# EasyEDA Pro project curtain-lifter.epro, board PCB2
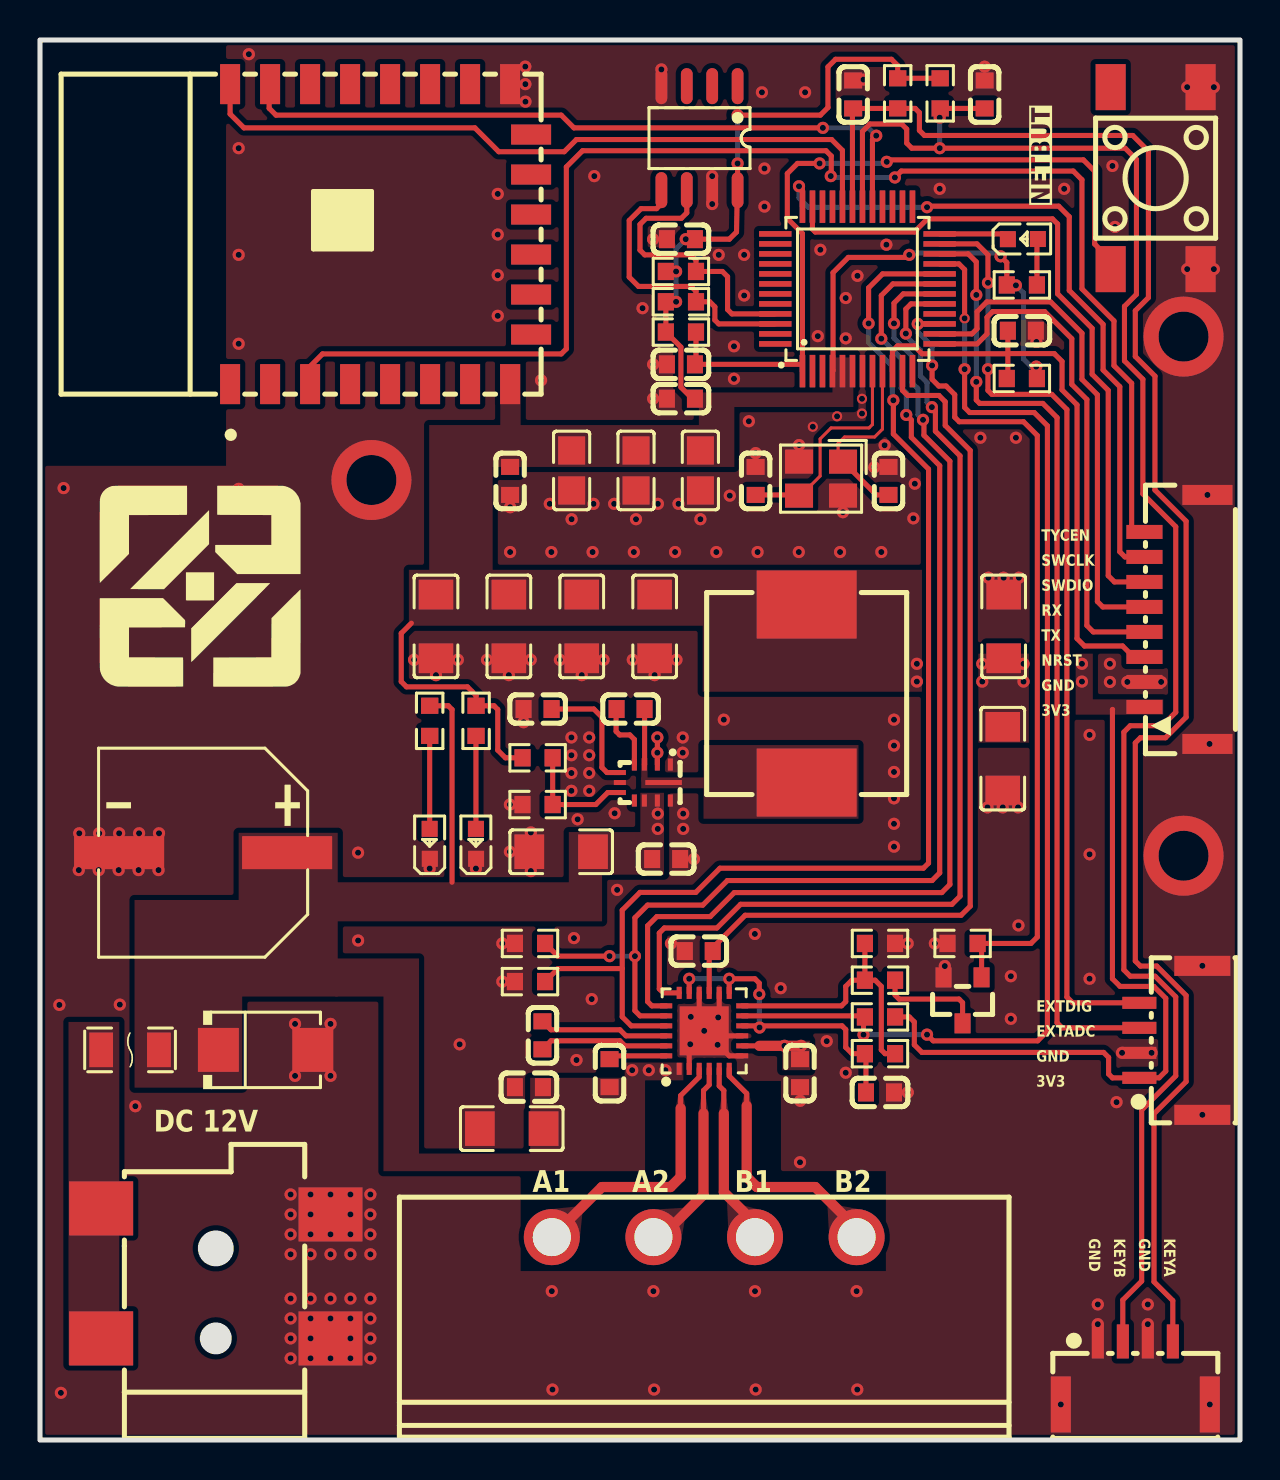
[diagram p8: board, top side]
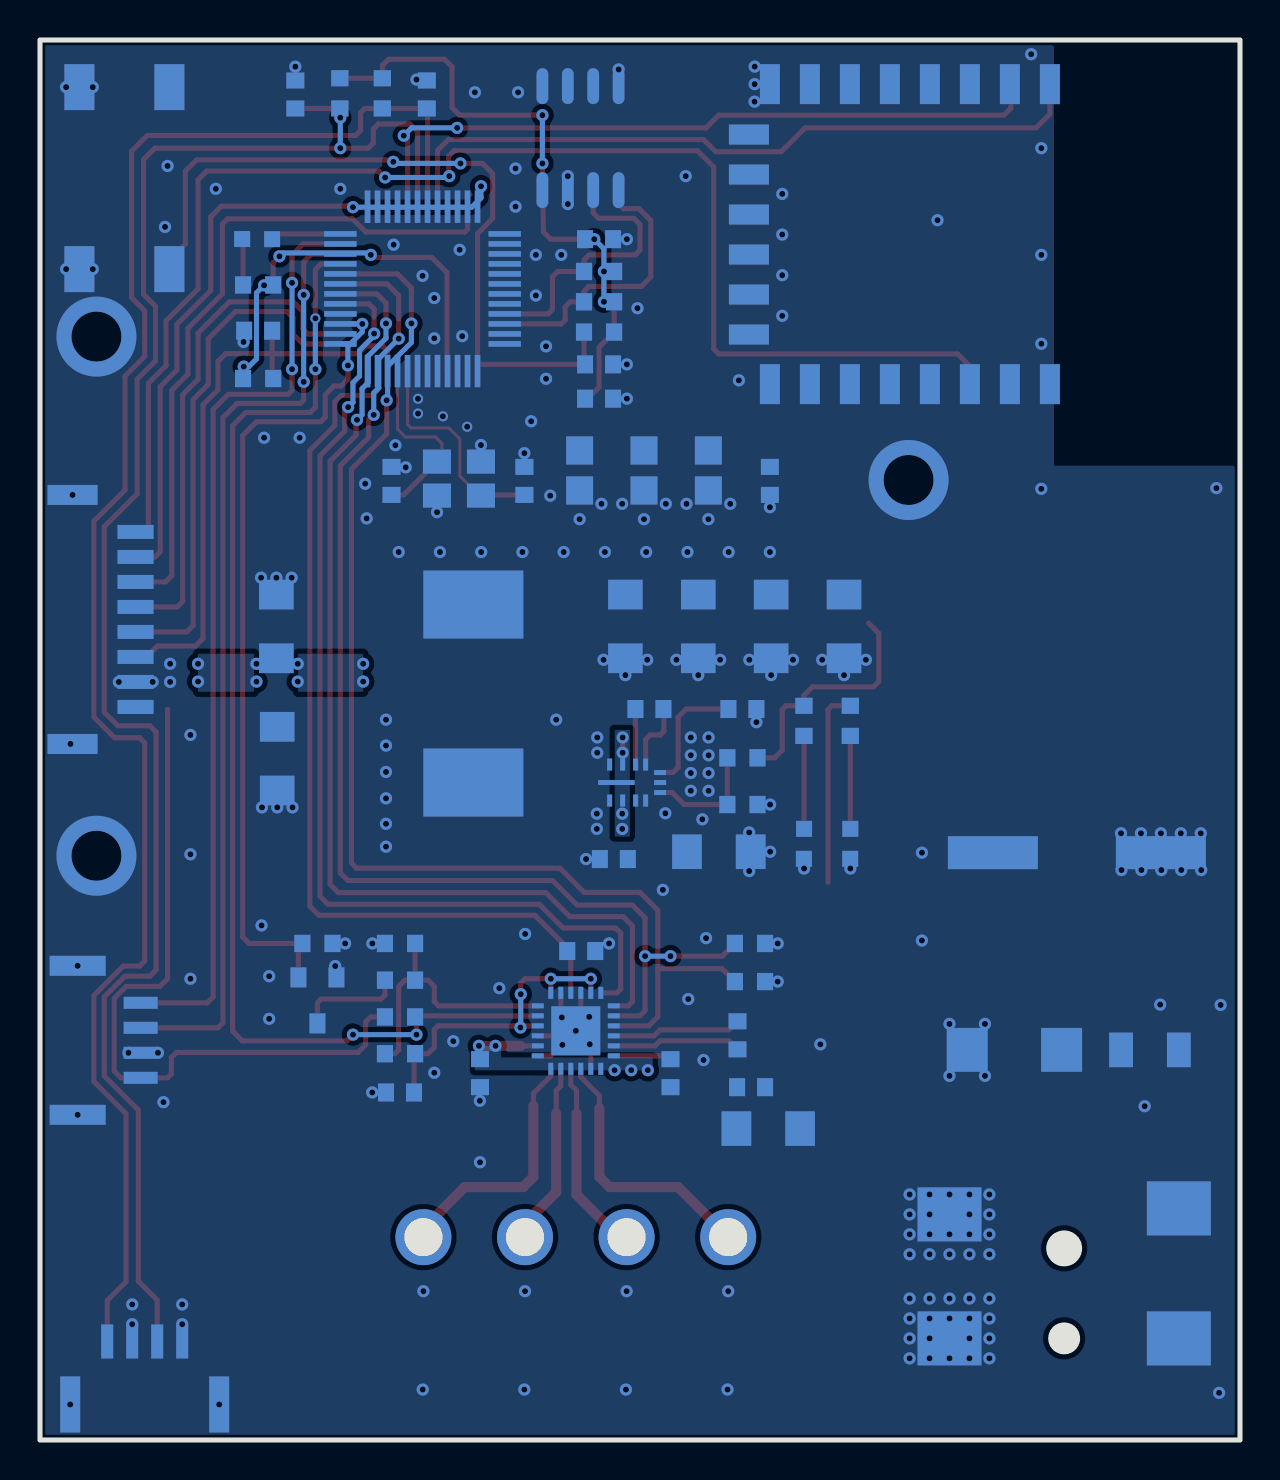
[diagram p9: board, bottom side, seen from below]

Outline 60 x 70 mm; copper layers: Top Layer, Bottom Layer. Coordinates in mm from the lower left corner of the outline.
Outline path: rectangle 0,70 60,0
Stack: Top Layer 0.035mm / Dielectric1 1.51mm FR4 er 4.5 / Bottom Layer 0.035mm

## Design rules (mm)
spacing copperThickness1oz (default): track to track 0.102, other pairs 0.152 to 0.3
spacing copperThickness2oz: track to track 0.203, other pairs 0.152 to 0.3
track width copperThickness1oz (default): min 0.127, default 0.254, max 2.54
track width copperThickness2oz: min 0.203, default 0.254, max 2.54
differential pair differentialPair (default): width min 0.127, default 0.254, max 2.54; gap min 0.152, default 0.152

## Placement (name value [footprint] x y rotation side)
C1  10uF  [C1206]  26.06 29.41 180 top
C2  100nF  [C0603]  31.31 29.05 0 top
C3  1uF  [C0603]  24.88 36.55 180 top
C4  100nF  [C0603]  29.53 36.55 0 top
C6  10uF  [C0805]  26.58 48.48 270 top
C7  12pF  [C0603]  35.78 47.95 270 top
C8  12pF  [C0603]  42.42 47.95 270 top
C9  10nF  [C0603]  24.44 17.64 180 top
C10  10nF  [C0603]  38 18.34 270 top
C11  10uF  [C1206]  23.59 15.57 0 top
C12  1uF  [C0603]  42 17.38 0 top
C13  22nF  [C0603]  25.12 20.23 270 top
C14  220nF  [C0603]  28.48 18.34 270 top
C15  1nF  [C0603]  32.94 24.45 180 top
C16  100nF  [C0603]  32.05 52.07 180 top
C17  10uF  [C0805]  29.8 48.48 270 top
C18  10uF  [C0805]  33.02 48.48 270 top
C19  100nF  [C0603]  32.05 60.04 180 top
C20  100nF  [C0603]  47.23 67.28 90 top
C21  100nF  [C0603]  23.51 47.95 270 top
C22  470uF  [CAP-SMD_BD10.0-L10.3-W10.3-LS11.0]  8.16 29.37 180 top
C23  22uF  [C1206]  48.18 40.68 90 top
C24  22uF  [C1206]  19.8 40.68 90 top
C25  22uF  [C1206]  30.73 40.68 90 top
C26  22uF  [C1206]  23.44 40.68 90 top
C27  22uF  [C1206]  27.09 40.68 90 top
C28  100nF  [C0603]  40.66 67.28 270 top
C29  100nF  [C0603]  49.09 55.46 180 top
C30  100nF  [C0603]  32.05 53.78 0 top
C31  22uF  [C1206]  48.14 34.07 270 top
CN1  SH-SM08B-GHS-TB(LF)(SN)  [CONN-SMD_SH-SM08B-GHS-TB]  56.8 41.03 90 top
CN2  DB2ERM-5.08-4P-GN  [CONN-TH_4P-P5.08_DB2ERM-5.08-4P]  33.21 10.14 0 top
D1  SMBJ15A  [SMB_L4.6-W3.6-LS5.3-RD]  11.28 19.51 0 top
DC1  DC-050-A250  [DC-IN-SMD_DC-050-A200]  8.79 8.33 90 top
F1  1206L200/16NR  [F1206]  4.5 19.51 0 top
L2  6.8uH  [IND-SMD_L11.0-W10.0_MDA1054HT]  38.33 37.32 90 top
LED1  XL-1608UBC-04  [LED0603-RD_BLUE]  19.49 29.81 90 top
LED2  XL-1608UBC-04  [LED0603-RD_BLUE]  21.8 29.81 90 top
LED3  XL-1608UBC-04  [LED0603-RD_BLUE]  49.14 60.05 0 top
Q2  CJ3400  [SOT-23_L2.9-W1.3-P1.90-LS2.4-BR]  46.13 21.98 90 top
R1  100kΩ  [R0603]  24.88 34.11 0 top
R2  43kΩ  [R0603]  24.88 31.77 180 top
R3  10kΩ  [R0603]  19.48 35.96 90 top
R4  56kΩ  [R0603]  42 19.32 0 top
R5  21kΩ  [R0603]  42 24.83 0 top
R6  10kΩ  [R0603]  42 22.99 0 top
R7  10kΩ  [R0603]  42 21.15 180 top
R8  10kΩ  [R0603]  24.5 24.83 180 top
R9  10kΩ  [R0603]  24.5 22.92 180 top
R10  10kΩ  [R0603]  45.01 67.33 90 top
R11  10kΩ  [R0603]  42.88 67.33 270 top
R12  10kΩ  [R0603]  32.05 58.43 180 top
R13  10kΩ  [R0603]  32.05 56.91 180 top
R14  10kΩ  [R0603]  49.09 53.08 180 top
R15  2kΩ  [R0603]  49.09 57.75 0 top
R16  100kΩ  [R0603]  46.13 24.83 180 top
R17  10kΩ  [R0603]  32.05 55.4 0 top
R19  2kΩ  [R0603]  21.8 35.96 270 top
SW2  KH-6X6X5H-STM  [SW-SMD_4P-L6.0-W6.0-P4.50-LS9.0_H5.0]  55.78 63.09 270 top
U1  LMR33630ARNXT  [VQFN-12_L3.0-W2.0-P0.65-BL_TI_LMR33630XRNXT]  30.26 32.87 180 top
U2  DRV8434ARGER  [VQFN-24_L4.0-W4.0-P0.50-TL-EP2.5]  33.21 20.46 90 top
U3  STM32G030C8T6  [LQFP-48_L7.0-W7.0-P0.50-LS9.0-BL_1]  40.87 57.56 0 top
U4  AT24C16C-SSHM-T  [SOIC-8_L4.9-W3.9-P1.27-LS6.0-BL]  32.97 65.09 180 top
U5  T1-3S  [WIFIM-SMD_22P-L24.0-W16.0-P2.00_TI-3S]  17.03 60.29 90 top
U6  WAFER-GH1.25-4PWB  [CONN-SMD_4P-P1.25_XUNPU_WAFER-GH1.25-4PWB]  54.76 3.35 0 top
U7  WAFER-GH1.25-4PWB  [CONN-SMD_4P-P1.25_XUNPU_WAFER-GH1.25-4PWB]  56.54 19.98 90 top
X1  8MHz  [CRYSTAL-SMD_4P-L3.2-W2.5-BL]  39.05 48.07 180 top

## Footprints (pads in the part's own frame, mm; a bottom-side part is the same pattern mirrored in y, then rotated)
C0603
  rect 0.8x0.9 hole 0.001: 1(-0.7,0) 2(0.7,0)
C0805
  rect 1.41x1.35 hole 0.001: 1(-1,0) 2(1,0)
C1206
  rect 1.485x1.728 hole 0.001: 1(-1.593,0) 2(1.593,0)
CAP-SMD_BD10.0-L10.3-W10.3-LS11.0
  rect 4.5x1.65 hole 0.001: 1(-4.2,0) 2(4.2,0)
CONN-SMD_4P-P1.25_XUNPU_WAFER-GH1.25-4PWB
  rect 0.6x1.7 hole 0.001: 1(-1.875,1.575) 2(-0.625,1.575) 3(0.625,1.575) 4(1.875,1.575)
  rect 1x2.8 hole 0.001: 5(3.725,-1.575) 6(-3.725,-1.575)
CONN-SMD_SH-SM08B-GHS-TB
  rect 0.7x1.8 hole 0.001: 1(-4.375,1.575) 2(-3.125,1.575) 3(-1.875,1.575) 4(-0.625,1.575) 5(0.625,1.575) 6(1.875,1.575) 7(3.125,1.575) 8(4.375,1.575)
  rect 1x2.5 hole 0.001: 9(6.225,-1.575) 10(-6.225,-1.575)
CONN-TH_4P-P5.08_DB2ERM-5.08-4P
  round 2.8 hole 1.9: 1(-7.62,0) 2(-2.54,0) 3(2.54,0) 4(7.62,0)
CRYSTAL-SMD_4P-L3.2-W2.5-BL
  rect 1.4x1.2 hole 0.001: 1(-1.1,-0.85) 2(1.1,-0.85) 3(1.1,0.85) 4(-1.1,0.85)
DC-IN-SMD_DC-050-A200
  rect 2.7x3.2 hole 0.001: 3(-3.25,-5.734) 4(2.95,-5.734) 5(-3.25,5.734) 5(3.25,5.734)
F1206
  rect 1.19x1.728 hole 0.001: 1(-1.445,0) 2(1.445,0)
IND-SMD_L11.0-W10.0_MDA1054HT
  rect 3.4x5 hole 0.001: 1(-4.45,0) 2(4.45,0)
LED0603-RD_BLUE
  rect 0.8x0.8 hole 0.001: 1(-0.749,-0.004) 2(0.749,0.004)
LQFP-48_L7.0-W7.0-P0.50-LS9.0-BL_1
  rect 0.28x1.62 hole 0.001: 1(-2.75,-4.11) 2(-2.25,-4.11) 3(-1.75,-4.11) 4(-1.25,-4.11) 5(-0.75,-4.11) 6(-0.25,-4.11) 7(0.25,-4.11) 8(0.75,-4.11) 9(1.25,-4.11) 10(1.75,-4.11) 11(2.25,-4.11) 12(2.75,-4.11) 25(2.75,4.11) 26(2.25,4.11) 27(1.75,4.11) 28(1.25,4.11) 29(0.75,4.11) 30(0.25,4.11) 31(-0.25,4.11) 32(-0.75,4.11) 33(-1.25,4.11) 34(-1.75,4.11) 35(-2.25,4.11) 36(-2.75,4.11)
  rect 1.62x0.28 hole 0.001: 13(4.11,-2.75) 14(4.11,-2.25) 15(4.11,-1.75) 16(4.11,-1.25) 17(4.11,-0.75) 18(4.11,-0.25) 19(4.11,0.25) 20(4.11,0.75) 21(4.11,1.25) 22(4.11,1.75) 23(4.11,2.25) 24(4.11,2.75) 37(-4.11,2.75) 38(-4.11,2.25) 39(-4.11,1.75) 40(-4.11,1.25) 41(-4.11,0.75) 42(-4.11,0.25) 43(-4.11,-0.25) 44(-4.11,-0.75) 45(-4.11,-1.25) 46(-4.11,-1.75) 47(-4.11,-2.25) 48(-4.11,-2.75)
R0603
  rect 0.806x0.864 hole 0.001: 1(-0.753,0) 2(0.753,0)
SMB_L4.6-W3.6-LS5.3-RD
  rect 2.047x2.192 hole 0.001: 1(-2.361,0) 2(2.361,0)
SOIC-8_L4.9-W3.9-P1.27-LS6.0-BL
  oval 0.588x1.8 hole 0.001: 1(-1.905,-2.6) 2(-0.635,-2.6) 3(0.635,-2.6) 4(1.905,-2.6) 5(1.905,2.6) 6(0.635,2.6) 7(-0.635,2.6) 8(-1.905,2.6)
SOT-23_L2.9-W1.3-P1.90-LS2.4-BR
  rect 1x0.8 hole 0.001: 1(1.15,-0.95) 2(1.15,0.95) 3(-1.15,0)
SW-SMD_4P-L6.0-W6.0-P4.50-LS9.0_H5.0
  rect 2.3x1.5 hole 0.001: 1(-4.55,2.25) 2(4.55,2.25) 3(-4.55,-2.25) 4(4.55,-2.25)
VQFN-12_L3.0-W2.0-P0.65-BL_TI_LMR33630XRNXT
  rect 0.25x0.6 hole 0.001: 1(-1.262,-0.9) 2(-0.613,-0.9) 3(0.037,-0.9) 4(0.537,-0.9) 8(0.537,0.9) 9(0.037,0.9) 10(-0.613,0.9) 11(-1.262,0.9)
  rect 0.6x0.25 hole 0.001: 5(1.262,-0.5) 6(1.262,0) 7(1.262,0.5)
  rect 1.825x0.25 hole 0.001: 12(-0.925,0)
VQFN-24_L4.0-W4.0-P0.50-TL-EP2.5
  rect 0.6x0.25 hole 0.001: 1(-1.9,1.25) 2(-1.9,0.75) 3(-1.9,0.25) 4(-1.9,-0.25) 5(-1.9,-0.75) 6(-1.9,-1.25) 13(1.9,-1.25) 14(1.9,-0.75) 15(1.9,-0.25) 16(1.9,0.25) 17(1.9,0.75) 18(1.9,1.25)
  rect 0.25x0.6 hole 0.001: 7(-1.25,-1.9) 8(-0.75,-1.9) 9(-0.25,-1.9) 10(0.249,-1.9) 11(0.75,-1.9) 12(1.25,-1.9) 19(1.25,1.9) 20(0.75,1.9) 21(0.249,1.9) 22(-0.25,1.9) 23(-0.75,1.9) 24(-1.25,1.9)
  rect 2.45x2.45 hole 0.001: 25(0,0)
WIFIM-SMD_22P-L24.0-W16.0-P2.00_TI-3S
  rect 2x1 hole 0.001: 1(-7.5,7.525) 2(-7.5,5.525) 3(-7.5,3.525) 4(-7.5,1.525) 5(-7.5,-0.475) 6(-7.5,-2.475) 7(-7.5,-4.475) 8(-7.5,-6.475) 9(7.5,-6.475) 10(7.5,-4.475) 11(7.5,-2.475) 12(7.5,-0.475) 13(7.5,1.525) 14(7.5,3.525) 15(7.5,5.525) 16(7.5,7.525)
  rect 1x2 hole 0.001: 17(-5.02,-7.525) 18(-3.02,-7.525) 19(-1.02,-7.525) 20(0.98,-7.525) 21(2.98,-7.525) 22(4.98,-7.525)

## Nets
As in the schematic.

Pads without a net: SW2 3; U1 8; U3 2 3 12 16 25 26 27 28 33 34 37 38 39 40 41 42 43 44 47 48; U4 1 2 3; U5 1 2 4 5 6 7 10 11 12 13 14 17 18 19 20 21 22

## Via types
v1: diameter 0.61, hole 0.305, Top Layer to Bottom Layer, 297 vias
v2: diameter 0.508, hole 0.305, Top Layer to Bottom Layer, 5 vias
v3: diameter 4, hole 2.5, Top Layer to Bottom Layer, 3 vias

## Routing (per net, layer and track width the routed paths; a pad name or vN(x,y) marks a point on that pad's centre or on a via; arc(x,y) is an arc through that point)
3V3: length 99
  Top Layer w0.254: v1(32.29,60.04) C19.1 34.47,60.04 34.83,60.4 34.88,63.19 ; CN1.1 55.22,36.65 ; 53.63,36.53 53.62,36.52 53.62,23.06 54,22.68 55.69,22.68 56.29,22.08 56.29,18.44 55.95,18.11 U7.1 ; R7.1 43.47,21.15 43.72,20.9 43.72,19.76 44.1,19.38 53.18,19.38 53.43,19.13 53.43,18.3 53.62,18.11 54.1,18.11 ; 18.57,40.84 18.06,40.33 18.06,37.92 18.32,37.66 21.37,37.66 21.8,37.23 R19.1 22.7,36.71 22.89,36.52 22.89,34.49 23.27,34.11 R1.1 ; 31.29,56.91 31.29,55.4 32.05,54.64 32.05,52.64 32.62,52.07 C16.1 ; v1(43.46,59.26) 43.34,59.13 40.41,59.13 39.65,58.37 39.65,53.47 39.62,53.44 ; v1(34.88,66.24) 39.02,66.24 39.4,66.62 39.4,68.66 39.78,69.04 42.57,69.04 42.88,68.72 R11.1 R10.2 ; v1(34.88,63.83) 34.88,63.19 ; 34.88,63.19 34.88,62.49 ; v1(48.03,59.18) 48.34,58.87 R15.1
  Bottom Layer w0.254: v1(34.88,63.83) v1(34.88,66.24) ; v1(31.8,56.91) v1(31.8,58.43) 31.8,59.56 v1(32.29,60.04) ; v1(43.46,59.26) 43.56,59.35 47.86,59.35 v1(48.03,59.18) ; v1(48.8,57.73) 49.18,57.35 49.18,54.05 49.56,53.67 v1(49.81,53.67)
  vias: v1(43.84,38.81) v1(43.84,37.92) v1(47.11,38.81) v1(47.11,37.92) v1(49.18,38.81) v1(49.18,37.92) v1(52.1,38.81) v1(52.1,37.92)
12V_PROT: length 14.1
  Top Layer w0.254: U2.8 35.97,19.71 ; U1.2 v1(30.87,34.36) v1(30.87,35.13) ; R3.2 20.41,36.71 20.6,36.52 20.6,27.89
  Top Layer w0.508: 35.97,19.71 v1(37.22,19.71) v1(38.05,19.71)
  vias: v1(29.61,18.49) v1(30.44,18.49) v1(30.89,31.32) v1(30.89,30.56) v1(31.27,18.49)
GND: length 10.3
  Top Layer w0.254: U2.16 32.96,20.71 v1(33.21,20.46) ; v1(33.21,20.46) 32.46,19.71 U2.2 ; v1(33.21,20.46) 33.96,21.21 U2.14 ; v1(26.57,32.46) 26.57,32.62 ; U2.7 34.46,19.21 33.46,20.21 U2.9
  vias: v1(0.97,21.75) v1(1.05,2.36) v1(1.18,47.6) v1(1.94,28.5) v1(1.96,30.34) v1(2.94,28.5) v1(2.96,30.34) v1(3.93,28.5) v1(3.96,30.34) v1(3.99,21.77) v1(4.77,16.69) v1(4.93,28.5) v1(4.95,30.34) v1(5.93,28.5) v1(5.95,30.34) v1(9.93,64.59) v1(9.93,59.26) v1(9.93,54.81) v1(9.94,47.56) v1(10.44,69.29) v1(12.53,12.28) v1(12.53,11.28) v1(12.53,10.28) v1(12.53,9.29) v1(12.53,7.07) v1(12.53,6.08) v1(12.53,5.08) v1(12.53,4.08) v1(12.75,20.81) v1(12.75,18.21) v1(13.53,12.28) v1(13.53,11.28) v1(13.53,10.28) v1(13.53,9.29) v1(13.53,7.07) v1(13.53,6.08) v1(13.53,5.08) v1(13.53,4.08) v1(14.53,20.81) v1(14.53,18.21) v1(14.53,12.28) v1(14.53,10.28) v1(14.53,9.29) v1(14.53,7.07) v1(14.53,6.08) v1(14.53,4.08) v1(15.12,60.99) v1(15.52,12.28) v1(15.52,11.28) v1(15.52,10.28) v1(15.52,9.29) v1(15.52,7.07) v1(15.52,6.08) v1(15.52,5.08) v1(15.52,4.08) v1(15.9,29.37) v1(15.91,24.97) v1(16.52,12.28) v1(16.52,11.28) v1(16.52,10.28) v1(16.52,9.29) v1(16.52,7.07) v1(16.52,6.08) v1(16.52,5.08) v1(16.52,4.08) v1(18.71,39.01) v1(19.48,28.57) v1(19.8,38.24) v1(20.89,39.01) v1(20.98,19.78) v1(21.8,28.57) v1(22.35,39.01) v1(22.89,62.31) v1(22.89,60.27) v1(22.89,58.24) v1(22.89,56.21) v1(23.12,24.83) v1(23.12,22.92) v1(23.44,38.24) v1(23.51,46.64) v1(23.51,44.4) v1(23.5,31.77) v1(23.5,29.41) v1(24.18,35.89) v1(24.26,68.67) v1(24.27,67.79) v1(24.27,66.92) v1(24.54,39.01) v1(24.54,30.38) v1(24.54,28.45) v1(25.06,52.98) v1(25.49,46.81) v1(25.57,44.4) v1(25.59,7.44) v1(25.62,2.52) v1(25.99,39.01) v1(26.58,46.04) v1(26.57,35.13) v1(26.57,34.24) v1(26.57,33.35) v1(26.7,25.09) v1(26.82,19) v1(26.88,31.03) v1(27.09,38.24) v1(27.46,35.13) v1(27.46,34.24) v1(27.46,33.35) v1(27.46,32.46) v1(27.63,44.4) v1(27.59,22.05) v1(27.71,63.19) v1(27.67,46.81) v1(28.18,39.01) v1(28.71,46.81) v1(28.73,31.34) v1(28.86,27.51) v1(29.64,39.01) v1(29.69,44.4) v1(29.8,46.04) v1(30.13,56.59) v1(30.66,60.04) v1(30.66,53.78) v1(30.66,52.07) v1(30.73,38.24) v1(30.67,7.44) v1(30.7,2.52) v1(30.89,46.81) v1(31.07,68.53) v1(31.55,24.83) v1(31.75,44.4) v1(31.82,39.01) v1(31.93,46.81) v1(32.14,35.13) v1(32.14,34.36) v1(32.16,31.32) v1(32.16,30.56) v1(32.54,21.16) v1(32.51,19.79) v1(32.7,29.05) v1(33.02,46.04) v1(33.61,63.19) v1(33.61,61.8) v1(33.82,44.4) v1(33.94,59.26) v1(33.91,21.13) v1(33.88,19.76) v1(34.19,36.02) v1(34.49,47.22) v1(34.7,54.69) v1(34.7,53.06) v1(35.21,59.26) v1(35.21,57.22) v1(35.44,50.94) v1(35.74,25.3) v1(35.78,49.34) v1(35.75,7.44) v1(35.78,2.52) v1(35.88,44.4) v1(36.1,67.39) v1(36.22,63.58) v1(36.22,61.67) v1(37.03,22.59) v1(37.94,44.4) v1(37.95,49.75) v1(38.01,16.96) v1(38,13.89) v1(38.25,67.39) v1(38.89,55.19) v1(39.02,59.51) v1(39.34,19.94) v1(40,44.4) v1(40.15,46.39) v1(40.29,57.1) v1(40.29,55.08) v1(40.29,18.36) v1(40.83,7.44) v1(40.87,58.21) v1(40.86,2.52) v1(41.18,68.02) v1(41.71,48.63) v1(42.06,44.4) v1(42.23,49.74) v1(42.32,59.77) v1(42.7,36.02) v1(42.7,34.72) v1(42.7,33.4) v1(42.7,32.08) v1(42.7,30.81) v1(42.7,29.67) v1(43.38,24.83) v1(43.39,17.38) v1(43.74,47.81) v1(43.67,46.08) v1(44.74,24.83) v1(44.99,62.56) v1(45.24,23.7) v1(47.02,50.11) v1(47.23,68.67) v1(47.42,43.12) v1(47.37,31.63) v1(48.14,31.63) v1(48.18,43.12) v1(48.54,23.19) v1(48.54,21.06) v1(48.8,50.11) v1(48.95,43.12) v1(48.9,31.63) v1(48.92,25.73) v1(49.82,54.9) v1(51.04,1.78) v1(51.21,62.56) v1(52.48,35.25) v1(52.48,29.28) v1(52.48,23.06) v1(52.89,6.78) v1(52.89,5.79) v1(53.5,38.81) v1(53.5,37.9) v1(53.62,63.7) v1(53.75,60.65) v1(53.83,16.89) v1(54.1,19.36) v1(54.37,37.9) v1(55.39,6.78) v1(55.39,5.79) v1(55.58,19.36) v1(56.06,37.9) v1(57.36,67.64) v1(57.36,58.54) v1(58.12,23.71) v1(58.12,16.26) v1(58.37,47.25) v1(58.48,34.8) v1(58.49,1.78) v1(58.69,67.64) v1(58.69,58.54) v2(38.64,50.66) v2(39.85,51.18) v2(41.1,52.06) v2(41.1,51.32) v3(16.57,48) v3(57.18,55.17) v3(57.18,29.21)
DEBUG_RX: length 25.1
  Top Layer w0.254: U3.14 46.6,55.31 46.85,55.56 46.85,56.42 47.34,56.91 50.53,56.91 52.1,55.34 52.1,53.03 52.87,52.26 52.87,41.92 53.14,41.65 CN1.5
DEBUG_TX: length 26
  Top Layer w0.254: U3.13 46.86,54.81 47.35,55.3 47.35,56.14 47.64,56.42 50.23,56.42 51.59,55.06 51.59,52.78 52.34,52.03 52.34,40.72 52.66,40.4 CN1.4
DRV_DIR: length 53.5
  Top Layer w0.254: U2.19 30.59,21.71 30.38,21.92 30.38,25.71 30.84,26.17 33.51,26.17 34.71,27.37 45.09,27.37 45.49,27.78 45.49,48.94 44.2,50.24 44.2,50.96 v1(44.15,51.01) ; v1(42.7,55.83) 42.7,56.84 43.16,57.31 U3.18
  Bottom Layer w0.254: v1(44.15,51.01) 43.9,51.26 43.9,52.57 43.59,52.88 43.59,54.2 42.7,55.09 v1(42.7,55.83)
DRV_DVDD: length 16.4
  Top Layer w0.254: U2.10 40.1,20.71 40.29,20.52 40.29,19.63 40.6,19.32 R4.1 41.3,19.26 C12.1 ; U2.13 v1(34.46,23.06) 35.74,23.06 35.96,22.84 v1(35.96,22.29) ; U2.17 v1(32.46,23.06)
  Bottom Layer w0.254: v1(35.96,22.29) 35.96,20.64 v1(35.98,20.62) ; v1(32.46,23.06) v1(34.46,23.06)
DRV_ENABLE: length 60.5
  Top Layer w0.254: v1(43.31,51.26) 43.57,51 43.57,50.14 44.99,48.72 44.99,28.36 44.6,27.97 34.37,27.97 33.14,26.75 30.38,26.75 29.75,26.11 v1(29.75,24.19) 29.75,21.47 30,21.21 U2.20 ; R8.1 25.89,24.19 v1(28.48,24.19) ; v1(42.06,55.07) 42.06,57.22 42.65,57.81 U3.19
  Bottom Layer w0.254: v1(29.75,24.19) v1(28.48,24.19) ; v1(43.31,51.26) 43.31,52.36 43.06,52.61 43.06,54.08 42.07,55.07 v1(42.06,55.07)
DRV_NFAULT: length 59.7
  Top Layer w0.254: v2(46.23,56.08) 46.23,58.52 45.95,58.81 U3.21 ; 41.19,21.21 R7.2 ; 41.19,21.21 U2.11 ; 41.19,21.21 41.18,21.19 v1(41.18,20.27) ; v1(46.23,53.54) 46.23,51.63 46.49,51.37 49.71,51.37 50.37,50.71 50.37,20.45 49.88,19.96 44.66,19.96 v1(44.35,20.27)
  Bottom Layer w0.254: v1(41.18,20.27) v1(44.35,20.27) ; v2(46.23,56.08) v1(46.23,53.54)
DRV_NSLEEP: length 62
  Top Layer w0.254: U2.21 29.56,20.71 29.11,21.16 29.11,23.57 ; 29.11,23.57 25.9,23.57 R9.1 ; 29.11,23.57 29.11,26.49 30,27.38 32.79,27.38 34,28.59 44.17,28.59 44.43,28.84 44.43,48.54 42.67,50.3 v1(42.67,51.99) ; v1(41.43,55.83) 41.43,57.61 42.13,58.31 U3.20
  Bottom Layer w0.254: v1(42.67,51.99) 42.62,52.04 42.62,53.69 41.43,54.88 v1(41.43,55.83)
DRV_STEP: length 51.9
  Top Layer w0.254: U3.17 43.55,56.81 43.29,56.55 v1(43.29,55.32) ; v1(44.59,51.64) 44.77,51.47 44.77,50.44 46,49.21 46,27.19 45.6,26.78 35.03,26.78 33.85,25.6 31.22,25.6 30.96,25.35 30.96,22.55 31.16,22.36 U2.18
  Bottom Layer w0.254: v1(44.59,51.64) 44.35,51.89 44.35,52.87 44.02,53.2 44.02,54.49 43.29,55.22 v1(43.29,55.32)
DRV_TRQ_CNT: length 44.9
  Top Layer w0.254: 33.64,24.45 33.64,24.62 35.26,26.24 46.06,26.24 46.51,26.69 46.51,49.48 45.26,50.73 45.26,51.91 44.94,52.23 43.38,52.23 43.12,52.48 43.12,53.44 ; U2.15 33.46,24.27
EEPROM_IIC_SCL: length 14.4
  Top Layer w0.254: U3.45 34.6,56.31 34.38,56.52 34.38,58.17 34.12,58.43 R12.1 32.8,59 32.54,59.26 30.24,59.26 30,59.49 30,60.78 30.31,61.09 32.07,61.09 32.34,61.36 32.34,62.49
EEPROM_IIC_SDA: length 14.4
  Top Layer w0.254: 31.08,62.42 31.08,61.82 30.83,61.57 30.05,61.57 29.46,60.98 29.46,58.15 29.93,57.68 32.56,57.68 32.8,57.44 R13.1 33.49,56.91 33.74,56.66 33.74,56 33.94,55.81 U3.46
EXT_SENSOR_ADC: length 47.8
  Top Layer w0.254: v1(46.81,52.91) 46.81,52 46.98,51.83 50.14,51.83 50.85,51.12 50.85,20.86 51.11,20.61 U7.3 ; v1(46.81,57.25) 46.81,58.9 46.41,59.31 U3.22
  Bottom Layer w0.254: v1(46.81,52.91) v1(46.81,57.25)
EXT_SENSOR_DIG: length 46.9
  Top Layer w0.254: U7.4 51.63,21.86 51.34,22.15 51.34,51.53 50.59,52.28 47.59,52.28 47.4,52.48 v1(47.4,53.54) ; U3.23 46.85,59.81 47.4,59.26 v1(47.4,57.86)
  Bottom Layer w0.254: v1(47.4,57.86) v1(47.4,53.54)
KEY_DOWN: length 86.3
  Top Layer w0.254: U3.31 40.62,66.54 C28.2 42.88,66.58 R11.2 43.76,66.58 43.97,66.37 43.97,65.48 44.22,65.23 54.64,65.23 55.42,64.44 55.42,57.12 54.76,56.46 54.76,54.18 55.75,53.19 55.75,47.5 57.31,45.94 57.31,36.14 56.27,35.11 55.02,35.11 54.76,34.86 54.76,23.95 55.02,23.7 55.84,23.7 57.31,22.23 57.31,17.92 55.7,16.31 55.7,7.91 56.64,6.97 U6.4
KEY_UP: length 87.8
  Top Layer w0.254: C20.1 47.23,66.58 R10.1 ; U3.30 41.12,65.43 41.5,65.8 43.08,65.8 43.34,65.55 43.34,64.84 43.59,64.59 v1(44.99,64.59) 54.26,64.59 54.82,64.03 54.82,57.28 54.22,56.68 54.22,53.96 55.14,53.04 55.14,47.31 56.79,45.66 56.79,36.39 56.11,35.71 54.51,35.71 54.19,35.4 54.19,23.51 54.51,23.19 55.75,23.19 56.79,22.15 56.79,18.2 55.08,16.5 55.08,7.94 54.14,7 U6.2
  Bottom Layer w0.254: v1(44.99,64.59) v1(44.99,66.11)
LED_STATUS: length 3.5
  Top Layer w0.254: U3.24 48.13,60.31 LED3.1
LOW_CURRENT_SEL: length 41.2
  Top Layer w0.254: 47.08,23.13 47.08,24.63 R16.1 49.55,24.83 49.87,25.15 49.87,50.22 49.18,50.91 45.96,50.91 45.74,51.14 45.74,52.27 45.3,52.7 44.94,52.7 44.6,53.03 v1(44.6,53.73) ; U3.15 v1(43.89,55.81)
  Bottom Layer w0.254: v1(44.6,53.73) 44.6,54.69 43.89,55.4 v1(43.89,55.81)
MCU_NRST: length 30.2
  Top Layer w0.254: 42.62,53.44 42.62,54.45 42.88,54.71 43.71,54.71 44.1,54.31 48.39,54.31 ; 48.47,54.32 50.71,54.32 51.1,53.93 51.1,52.51 51.85,51.76 51.85,40.07 52.22,39.7 54.13,39.7 54.68,39.15 CN1.3 ; R14.2 48.39,53.13 48.39,54.31 ; 48.39,54.31 C29.2
NETCONTROL_BTN: length 38.4
  Top Layer w0.254: 38.12,53.78 38.12,60.32 37.37,61.08 37.37,63.32 37.87,63.83 v1(38.98,63.83) ; 38.12,53.78 38.12,53.44 ; 38.12,53.78 C30.2 32.8,53.84 R17.2 ; 53.78,58.54 53.78,58.75 52.73,59.8 52.73,63.44 52.17,64.01 42.44,64.01 v1(42.34,63.91) ; 38.12,53.42 38.12,53.44
  Bottom Layer w0.254: v1(38.98,63.83) 42.26,63.83 v1(42.34,63.91)
SW: length 2.8
  Top Layer w0.254: C4.2 30.23,33.78 U1.3
SWCLK: length 34.8
  Top Layer w0.254: v1(37.95,62.69) 38.12,62.51 U3.36 ; v1(44.35,61.64) 44.4,61.69 50.93,61.69 51.46,61.16 51.46,57.48 53.15,55.79 53.15,53.5 53.99,52.67 53.99,44.41 54.25,44.15 CN1.7
  Bottom Layer w0.254: v1(44.35,61.64) 38.41,61.64 37.95,62.1 v1(37.95,62.69)
SWDIO: length 34.4
  Top Layer w0.254: U3.35 38.62,60.54 38.76,60.4 43.72,60.4 44.37,61.06 50.63,61.06 50.88,60.8 50.88,57.31 52.61,55.58 52.61,53.29 53.41,52.48 53.41,43.22 53.72,42.9 CN1.6
TUYA_CEN: length 70
  Top Layer w0.254: v1(39.54,63.19) 39.56,63.22 39.56,64.2 39.3,64.46 27.13,64.46 26.32,63.65 26.32,54.56 26.06,54.3 14.12,54.3 13.51,53.68 13.51,52.79 ; v1(42.74,63.13) 43.06,63.45 51.66,63.45 52.1,63.01 52.1,57.56 53.7,55.96 53.7,53.72 54.58,52.84 54.58,45.42 54.6,45.4 CN1.8
  Bottom Layer w0.254: v1(39.54,63.19) 39.61,63.13 v1(42.74,63.13)
TUYA_UART_RX: length 36.2
  Top Layer w0.254: 9.5,67.79 9.5,66.3 10.2,65.61 21.75,65.61 22.94,64.41 26.21,64.41 26.82,65.02 39.58,65.02 40.12,64.48 U3.32
TUYA_UART_TX: length 35.8
  Top Layer w0.254: 11.5,67.79 11.46,67.75 11.46,66.59 11.8,66.24 26.06,66.24 26.7,65.61 v1(39.14,65.61) ; U3.29 41.62,65.03 v1(41.81,65.22)
  Bottom Layer w0.254: v1(39.14,65.61) 41.42,65.61 v1(41.81,65.22)
$1N1510: length 6.2
  Top Layer w0.254: C3.1 27.69,36.55 28.09,36.14 28.09,33.63 28.35,33.37 U1.5
$1N1519: length 3.5
  Top Layer w0.254: U1.4 29.72,35.03 29.49,35.25 28.98,35.25 28.8,35.43 28.8,36.52 C4.1
$1N1616: length 5.9
  Top Layer w0.254: R1.2 R2.1 27.79,31.77 28.39,32.37 U1.7
$1N1778: length 4.6
  Top Layer w0.254: LED1.2 R3.1
$1N1782: length 4.6
  Top Layer w0.254: LED2.2 21.8,35.2 R19.2
$2N1305: length 13.5
  Top Layer w0.254: 32.03,16.59 32.03,17.22 32.96,18.15 U2.3
  Top Layer w0.508: 32.03,16.59 32.03,13.16 31.52,12.65 28.1,12.65 CN2.1
$2N1308: length 9.8
  Top Layer w0.254: U2.4 33.46,17.76 33.18,17.47 33.18,16.33
  Top Layer w0.508: 33.18,16.33 33.18,12.27 31.05,10.14 CN2.2
$2N1311: length 9.2
  Top Layer w0.254: 34.19,16.33 34.19,17.47 33.96,17.7 U2.5
  Top Layer w0.508: CN2.3 35.75,10.83 34.19,12.39 34.19,16.33
$2N1314: length 12.8
  Top Layer w0.254: 35.33,16.71 35.33,17.33 34.46,18.2 U2.6
  Top Layer w0.508: 35.33,16.71 35.33,13.16 35.84,12.65 38.76,12.65 40.83,10.58 CN2.4
$2N1397: length 13.8
  Top Layer w0.254: R6.1 40.6,22.99 40.29,22.68 40.29,21.92 40.08,21.71 U2.12 ; R6.1 R5.1 ; R6.1 41.76,22.99 42.06,22.68 42.06,19.51 42.26,19.32 R4.2
$2N1423: length 5.3
  Top Layer w0.254: 46.13,20.83 46.13,21.87 45.95,22.05 42.95,22.05 42.75,22.25 R6.2
$2N1428: length 6.5
  Top Layer w0.254: U2.23 29.25,19.71 29,19.96 25.55,19.96 C13.2
$2N1433: length 6.5
  Top Layer w0.254: U2.22 29.3,20.21 29,20.51 25.55,20.51 C13.1
$2N1438: length 2.9
  Top Layer w0.254: U2.24 28.64,19.21 C14.1
$3N1969: length 11.2
  Top Layer w0.152: 37.7,47.22 38.03,47.22 39.01,48.2 39.01,50.05 39.56,50.6 41.45,50.6 41.62,50.77 41.62,53.44
  Top Layer w0.254: 37.7,47.22 37.66,47.25 35.65,47.25
$3N1970: length 9.3
  Top Layer w0.152: 39.91,48.93 39.91,49.83 40.23,50.15 41.73,50.15 42.12,50.54 42.12,53.44
  Top Layer w0.254: C8.2 41.82,47.25 X1.1
$4N1127: length 2.3
  Top Layer w0.254: LED3.2 49.85,60 R15.2

## Copper pours and planes (outline as drawn; the poured copper is in the pictures)
3V3 on Top Layer: 46.92,39.32 49.44,39.32 49.44,34.87 46.92,34.87
3V3 on Top Layer: 51.78,39.32 56.16,39.32 56.16,36.27 51.78,36.27
3V3 on Top Layer: 19.46,53.8 40.67,53.8 40.67,43.38 19.46,43.38
3V3 on Top Layer: 39.59,54.13 40.64,54.13 40.64,52.78 39.59,52.78
3V3 on Top Layer: 18.44,43.51 44.1,43.51 44.1,37.41 18.44,37.41
3V3 on Bottom Layer: 49.3,39.32 52.1,39.32 52.1,37.41 49.3,37.41
3V3 on Bottom Layer: 43.84,39.32 47.09,39.32 47.09,37.41 43.84,37.41
12V_PROT on Top Layer: 14.76,24.08 32.17,24.08 32.17,13.44 14.76,13.44
12V_PROT on Top Layer: 14.63,32.36 31.2,32.36 31.2,25.93 14.63,25.93
12V_PROT on Top Layer: 37.11,19.96 38.51,19.96 38.51,18.49 37.11,18.49
12V_PROT on Top Layer: 4.73,30.36 14.89,30.36 14.89,17.62 4.73,17.62
12V_PROT on Bottom Layer: 29.37,19.71 38.25,19.71 38.25,18.49 29.37,18.49
12V_PROT on Bottom Layer: 30.51,35.51 31.27,35.51 31.27,30.17 30.51,30.17
GND on Top Layer: 0,70 60,70 60,0 0,0
GND on Bottom Layer: 0,70 60,70 60,0 0,0
SW on Top Layer: 30.06,34.75 40.92,34.75 40.92,31.06 30.06,31.06
$1N1384 on Top Layer: 1.42,20.9 3.97,20.9 3.97,3.76 1.42,3.76

Small or netless copper shapes (teardrops, artwork), in the pictures only: 9 on Top Layer

## Text on the board
Top Silkscreen Layer: EXTDIG | EXTADC | GND | 3V3 | TYCEN | SWCLK | SWDIO | RX | TX | NRST | KEYB | KEYA | NETBUT | DC 12V | A1 | A2 | B1 | B2
